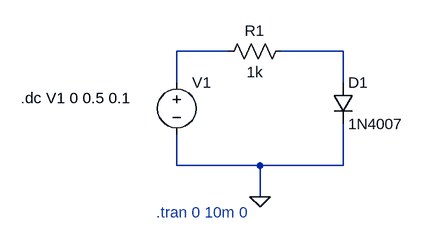
[diagram p0: schematic pnjunction.asc]
pnjunction.asc, the LTspice schematic file:
Version 4.1
SHEET 1 1320 680
WIRE 64 64 -16 64
WIRE 240 64 144 64
WIRE -16 112 -16 64
WIRE 240 112 240 64
WIRE -16 240 -16 192
WIRE 112 240 -16 240
WIRE 240 240 240 176
WIRE 240 240 112 240
WIRE 112 288 112 240
FLAG 112 288 0
SYMBOL diode 224 112 R0
SYMATTR InstName D1
SYMATTR Value 1N4007
SYMBOL res 160 48 R90
WINDOW 0 0 56 VBottom 2
WINDOW 3 32 56 VTop 2
SYMATTR InstName R1
SYMATTR Value 1k
SYMBOL voltage -16 96 R0
WINDOW 123 0 0 Left 0
WINDOW 39 0 0 Left 0
SYMATTR InstName V1
SYMATTR Value ""
TEXT -48 312 Left 2 ;.tran 0 10m 0
TEXT -256 136 Left 2 !.dc V1 0 0.5 0.1

The netlist it stands for:
* pnjunction.asc
D1 N002 0 1N4007
R1 N002 N001 1k
V1 N001 0
.model D D
.lib standard.dio
* .tran 0 10m 0
.dc V1 0 0.5 0.1
.backanno
.end